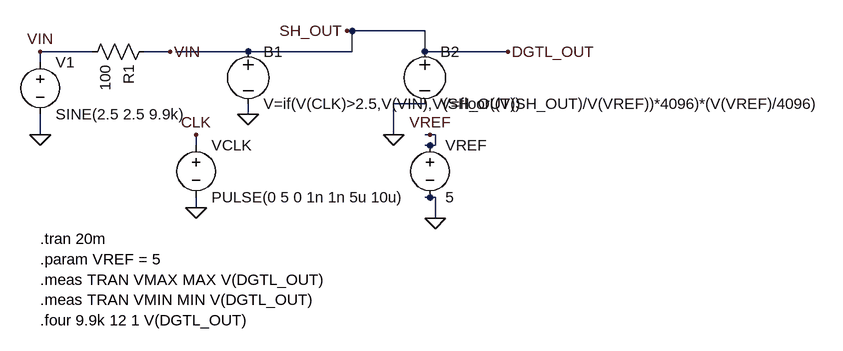
[diagram p0: schematic SAR.asc]
SAR.asc, the LTspice schematic file:
Version 4.1
SHEET 1 1364 680
WIRE 160 -800 152 -800
WIRE 272 -800 160 -800
WIRE -240 -768 -320 -768
WIRE -120 -768 -160 -768
WIRE 0 -768 -112 -768
WIRE 160 -768 160 -800
WIRE 160 -768 0 -768
WIRE 272 -768 272 -800
WIRE 400 -768 272 -768
WIRE -320 -752 -320 -768
WIRE 272 -688 224 -688
WIRE 0 -672 0 -688
WIRE -320 -640 -320 -672
WIRE 224 -640 224 -688
WIRE 280 -640 272 -640
WIRE 288 -640 280 -640
WIRE -80 -624 -80 -640
WIRE 280 -624 272 -624
WIRE 288 -624 288 -640
WIRE 288 -624 280 -624
WIRE 280 -544 272 -544
WIRE 288 -544 280 -544
WIRE -80 -528 -80 -544
WIRE 288 -512 288 -544
FLAG -320 -768 VIN
FLAG -120 -768 VIN
FLAG 152 -800 SH_OUT
FLAG 400 -768 DGTL_OUT
FLAG -80 -640 CLK
FLAG 280 -640 VREF
FLAG -80 -528 0
FLAG -320 -640 0
FLAG 288 -512 0
FLAG 0 -672 0
FLAG 224 -640 0
SYMBOL voltage -320 -768 R0
WINDOW 3 24 96 Left 0
SYMATTR Value SINE(2.5 2.5 9.9k)
SYMATTR InstName V1
SYMBOL res -144 -784 R90
SYMATTR InstName R1
SYMATTR Value 100
SYMBOL voltage -80 -640 R0
WINDOW 3 24 96 Left 0
SYMATTR Value PULSE(0 5 0 1n 1n 5u 10u)
SYMATTR InstName VCLK
SYMBOL voltage 280 -640 R0
WINDOW 3 24 96 Left 0
SYMATTR Value 5
SYMATTR InstName VREF
SYMBOL lib\\sym\\bv 0 -784 R0
WINDOW 3 24 96 Left 0
SYMATTR InstName B1
SYMATTR Value V=if(V(CLK)>2.5,V(VIN),V(SH_OUT))
SYMBOL lib\\sym\\bv 272 -784 R0
WINDOW 3 24 96 Left 0
SYMATTR InstName B2
SYMATTR Value V=floor((V(SH_OUT)/V(VREF))*4096)*(V(VREF)/4096)
TEXT -320 -480 Left 0 !.tran 20m\n.param VREF = 5\n.meas TRAN VMAX MAX V(DGTL_OUT)\n.meas TRAN VMIN MIN V(DGTL_OUT)\n.four 9.9k 12 1 V(DGTL_OUT)

The netlist it stands for:
* SAR.asc
V1 VIN 0 SINE(2.5 2.5 9.9k)
R1 VIN VIN 100
VCLK CLK 0 PULSE(0 5 0 1n 1n 5u 10u)
VREF VREF 0 5
B1 DGTL_OUT 0 V=if(V(CLK)>2.5,V(VIN),V(SH_OUT))
B2 DGTL_OUT 0 V=floor((V(SH_OUT)/V(VREF))*4096)*(V(VREF)/4096)
.tran 20m
.param VREF = 5
.meas TRAN VMAX MAX V(DGTL_OUT)
.meas TRAN VMIN MIN V(DGTL_OUT)
.four 9.9k 12 1 V(DGTL_OUT)
.backanno
.end